# Altium schematic sheet DC_link_control.SchDoc
size A4; SheetNumber: 6; SheetTotal: 6
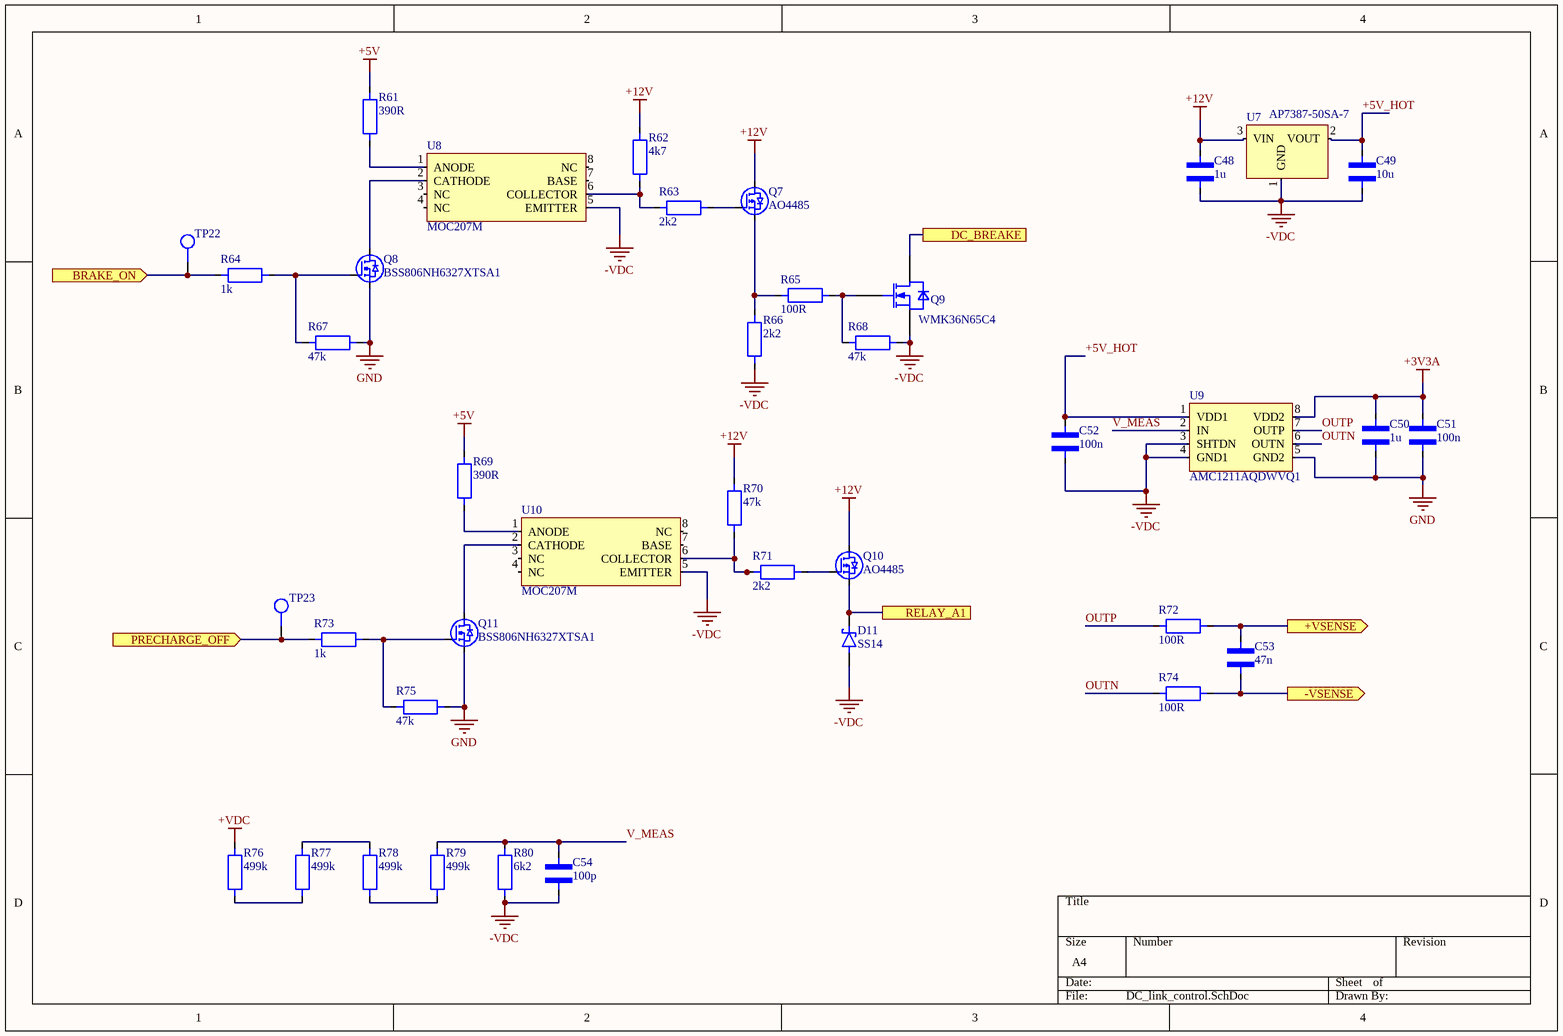
[diagram p0: DC_link_control.SchDoc]

## Parts
C48  1u  [Capacitor_0805]
C49  10u  [Capacitor_0805]
C50  1u  [Capacitor_0805]
C51  100n  [Capacitor_0805]
C52  100n  [Capacitor_0805]
C53  47n  [Capacitor_0805]
C54  100p  [Capacitor_0805]
D11  SS14  [DIOM5226X230N]
Q7  AO4485  [AO4485]
Q8  BSS806NH6327XTSA1  [BSS806NH6327XTSA1]
Q9  WMK36N65C4  [TO220-3]
Q10  AO4485  [AO4485]
Q11  BSS806NH6327XTSA1  [BSS806NH6327XTSA1]
R61  390R  [RESISTOR_0805]
R62  4k7  [RESISTOR_0805]
R63  2k2  [RESISTOR_0805]
R64  1k  [RESISTOR_0805]
R65  100R  [RESISTOR_0805]
R66  2k2  [RESISTOR_0805]
R67  47k  [RESISTOR_0805]
R68  47k  [RESISTOR_0805]
R69  390R  [RESISTOR_0805]
R70  47k  [RESISTOR_0805]
R71  2k2  [RESISTOR_0805]
R72  100R  [RESISTOR_0805]
R73  1k  [RESISTOR_0805]
R74  100R  [RESISTOR_0805]
R75  47k  [RESISTOR_0805]
R76  499k  [RESISTOR_1206]
R77  499k  [RESISTOR_1206]
R78  499k  [RESISTOR_1206]
R79  499k  [RESISTOR_1206]
R80  6k2  [RESISTOR_0805]
TP22  TestPoint  [TestPoint_1.5mm]  (value not drawn)
TP23  TestPoint  [TestPoint_1.5mm]  (value not drawn)
U7  AP7387-50SA-7  [SOT90P240X110-3N]
U8  MOC207M  [SOIC127P590X363-8N]
U9  AMC1211AQDWVQ1  [SOIC127P1150X275-8N]
U10  MOC207M  [SOIC127P590X363-8N]

## Ports
+VSENSE (out), -VSENSE (out), BRAKE_ON (in), DC_BREAKE, PRECHARGE_OFF (in), RELAY_A1

## Nets
+3V3A: C50.2 C51.2 U9.8(VDD2)
+5V: R61.2 R69.2
+12V: C48.2 Q7.2(D) Q10.2(D) R62.2 R70.2 U7.3(VIN)
+VDC: R76.2
-VDC: C48.1 C49.1 C52.1 C54.1 D11.1(A) Q9.3(SOURCE) R66.2 R68.2 R80.1 U7.1(GND) U8.5(EMITTER) U9.3(SHTDN) U9.4(GND1) U10.5(EMITTER)
GND: C50.1 C51.1 Q8.3(S) Q11.3(S) R67.1 R75.1 U9.5(GND2)
+5V_HOT: C49.2 C52.2 U7.2(VOUT) U9.1(VDD1)
+VSENSE: C53.2 R72.2 ; port +VSENSE
-VSENSE: C53.1 R74.2 ; port -VSENSE
BRAKE_ON: R64.1 TP22.1 ; port BRAKE_ON
DC_BREAKE: Q9.2(DRAIN) ; port DC_BREAKE
OUTN: R74.1 U9.6(OUTN)
OUTP: R72.1 U9.7(OUTP)
PRECHARGE_OFF: R73.1 TP23.1 ; port PRECHARGE_OFF
RELAY_A1: D11.2(K) Q10.3(S) ; port RELAY_A1
V_MEAS: C54.2 R79.2 R80.2 U9.2(IN)
NetQ7_1: Q7.1(G) R63.1
NetQ7_3: Q7.3(S) R65.2 R66.1
NetQ8_1: Q8.1(G) R64.2 R67.2
NetQ8_2: Q8.2(D) U8.2(CATHODE)
NetQ9_1: Q9.1(GATE) R65.1 R68.1
NetQ10_1: Q10.1(G) R71.1
NetQ11_1: Q11.1(G) R73.2 R75.2
NetQ11_2: Q11.2(D) U10.2(CATHODE)
NetR61_1: R61.1 U8.1(ANODE)
NetR62_1: R62.1 R63.2 U8.6(COLLECTOR)
NetR69_1: R69.1 U10.1(ANODE)
NetR70_1: R70.1 R71.2 U10.6(COLLECTOR)
NetR76_1: R76.1 R77.1
NetR77_2: R77.2 R78.2
NetR78_1: R78.1 R79.1

Not connected (* = marked no-connect by the designer): U8 3(NC) 4(NC) 7(BASE) 8(NC); U10 3(NC) 4(NC) 7(BASE) 8(NC)

## Library data of the parts
C48-C54 = CAPACITOR_0805: MLCC capacitor in 0805 package
D11 = SS14: 1A, 40V, Schottky Rectifier; MF: Taiwan Semiconductor; SnapEDA_Link: https://www.snapeda.com/parts/SS14/taiwan/view-part/?ref=snap; Package: SMA-2 Taiwan Semiconductor; MP: SS14; Check_prices: https://www.snapeda.com/parts/SS14/taiwan/view-part/?ref=eda
Q7 Q10 = AO4485: Transistor: P-MOSFET; unipolar; -40V; -8A; 1.1W; SO8; pin to pad: 1>4 2>5+6+7+8 3>1+2+3
Q8 Q11 = BSS806NH6327XTSA1: Transistor: N-MOSFET; unipolar; 20V; 2.3A; 0.5W; SOT23
Q9 = WMK36N65C4: Transistor: N-MOSFET; WMOS™ C4; unipolar; 650V; 20A; Idm: 100A; 277W; Manufacturer: WAYON; ManufacturerPartNumber: WMK36N65C4; PackageReference: PG-TO220
R61-R75 = RESISTOR_0805: SMD resistor in 0805 package
R76-R79 = RESISTOR_1206: SMD resistor in 1206 package
R80 = RESISTOR_0805: SMD resistor in 0805 package; Tolerance: 0,1%
U7 = AP7387: WIDE INPUT VOLTAGE RANGE, 150mA ULDO REGULATOR; Manufacturer: Diodes Incorporated; Vout: 5V; Iout: 150mA
U8 U10 = MOC207M: 8-pin SOIC Single-Channel Phototransistor Output Optocoupler; Manufacturer: ONSEMI/Fairchild; Isolation voltage: 2,5kV; CTR: 100-200%; Vce: 30V; ton: 3,2us; toff: 4,7us
U9 = AMC1211: AMC1211-Q1 Automotive, High-Impedance, 2-V Input, Basic Isolated Amplifier; Manufacturer: Texas Instruments